# Altium schematic sheet Top_Sheet.SchDoc
size A4; DocumentNumber: 1; SheetNumber: 1; SheetTotal: 6
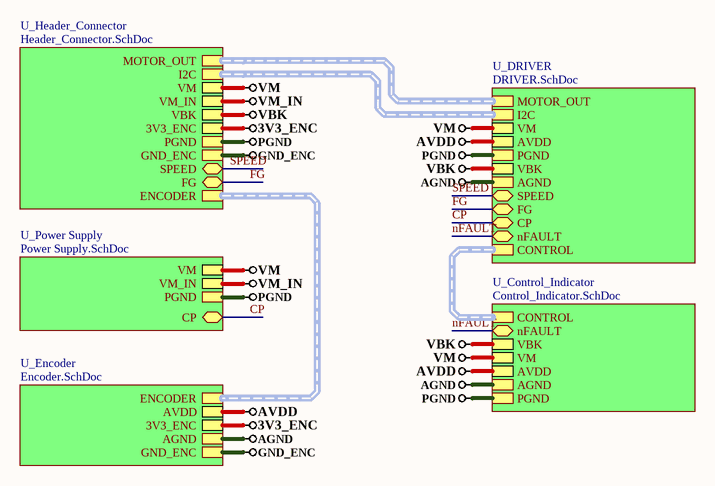
[diagram p0: Top_Sheet.SchDoc]

## Sub-sheets
U_Control_Indicator = Control_Indicator.SchDoc: VM, AVDD, PGND, VBK, AGND, CONTROL (harness CONTROL), nFAULT (bidir)
U_DRIVER = DRIVER.SchDoc: I2C (harness I2C), VM, AVDD, PGND, VBK, AGND, CONTROL (harness CONTROL), FG (bidir), nFAULT (bidir), CP (bidir), SPEED (bidir), MOTOR_OUT (harness MOTOR_OUT)
U_Encoder = Encoder.SchDoc: ENCODER (harness ENCODER), AVDD, AGND, 3V3_ENC, GND_ENC
U_Header_Connector = Header_Connector.SchDoc: MOTOR_OUT (harness MOTOR_OUT), VM, VBK, VM_IN, I2C (harness I2C), FG (bidir), ENCODER (harness ENCODER), SPEED (bidir), 3V3_ENC, PGND, GND_ENC
U_Power Supply = Power Supply.SchDoc: VM, VM_IN, PGND, CP (bidir)

## Nets
3V3_ENC: sheet U_Encoder/3V3_ENC, sheet U_Header_Connector/3V3_ENC
AGND: sheet U_Control_Indicator/AGND, sheet U_Encoder/AGND, sheet U_DRIVER/AGND
AVDD: sheet U_Control_Indicator/AVDD, sheet U_Encoder/AVDD, sheet U_DRIVER/AVDD
GND_ENC: sheet U_Encoder/GND_ENC, sheet U_Header_Connector/GND_ENC
PGND: sheet U_Control_Indicator/PGND, sheet U_Power Supply/PGND, sheet U_Header_Connector/PGND, sheet U_DRIVER/PGND
VBK: sheet U_Control_Indicator/VBK, sheet U_Header_Connector/VBK, sheet U_DRIVER/VBK
VM: sheet U_Control_Indicator/VM, sheet U_Power Supply/VM, sheet U_Header_Connector/VM, sheet U_DRIVER/VM
VM_IN: sheet U_Power Supply/VM_IN, sheet U_Header_Connector/VM_IN
CP: sheet U_Power Supply/CP, sheet U_DRIVER/CP
FG: sheet U_Header_Connector/FG, sheet U_DRIVER/FG
nFAULT: sheet U_Control_Indicator/nFAULT, sheet U_DRIVER/nFAULT
SPEED: sheet U_Header_Connector/SPEED, sheet U_DRIVER/SPEED

## Buses and harness runs
harness sheet U_Control_Indicator/CONTROL = sheet U_DRIVER/CONTROL
harness sheet U_DRIVER/I2C = sheet U_Header_Connector/I2C
harness sheet U_DRIVER/MOTOR_OUT = sheet U_Header_Connector/MOTOR_OUT
harness sheet U_Encoder/ENCODER = sheet U_Header_Connector/ENCODER

## Notes on the sheet
- File:
- Title:
- Date:
- Page
- Num:
- Total:
- Drawn By: Huzaifa Ali